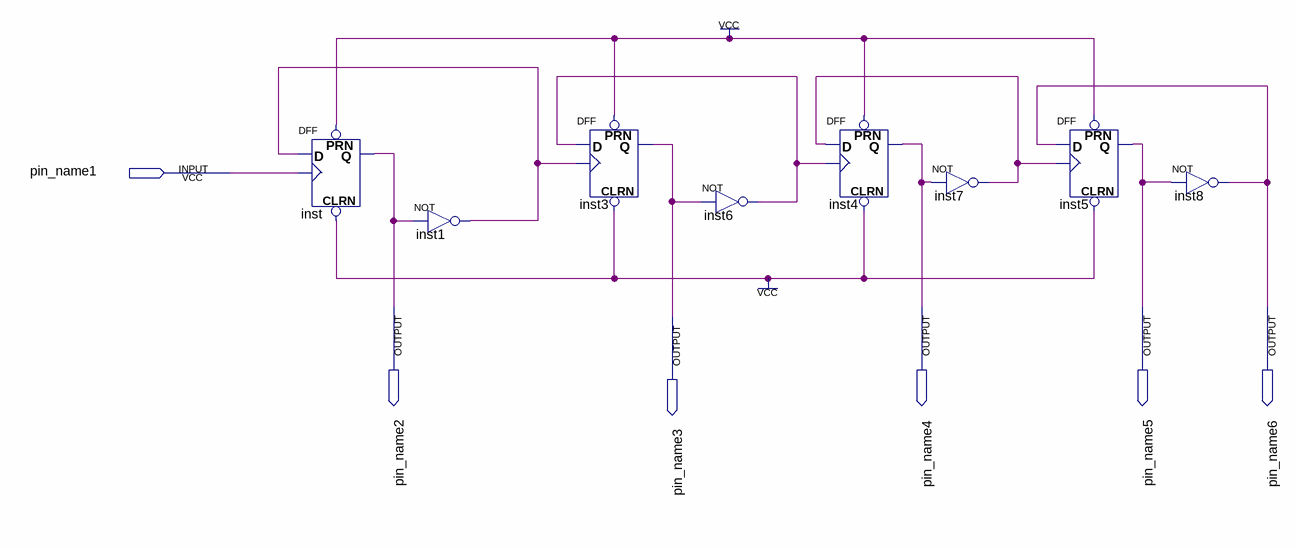
[diagram p0: schematic sheet]
// Quartus schematic contador_4bit.bdf as structural Verilog: 8 symbols, 6 pins
module contador_4bit (
  input  pin_name1,
  output pin_name2,
  output pin_name4,
  output pin_name5,
  output pin_name6,
  output pin_name3
);

  wire inst1_out, inst6_out, inst7_out;

  DFF inst (.CLRN(1'b1), .CLK(pin_name1), .D(inst1_out), .PRN(1'b1), .Q(pin_name2));
  not inst1 (inst1_out, pin_name2);
  DFF inst3 (.CLRN(1'b1), .CLK(inst1_out), .D(inst6_out), .PRN(1'b1), .Q(pin_name3));
  not inst6 (inst6_out, pin_name3);
  DFF inst4 (.CLRN(1'b1), .CLK(inst6_out), .D(inst7_out), .PRN(1'b1), .Q(pin_name4));
  not inst7 (inst7_out, pin_name4);
  DFF inst5 (.CLRN(1'b1), .CLK(inst7_out), .D(pin_name6), .PRN(1'b1), .Q(pin_name5));
  not inst8 (pin_name6, pin_name5);
endmodule
